# EAGLE schematic _ELRS_USB_TX.21faa46a-9219-4400-95b4-93692d36feac (EAGLE 9.7.0)

## Sheet 1 of 5: USB-C, protection and USB-UART
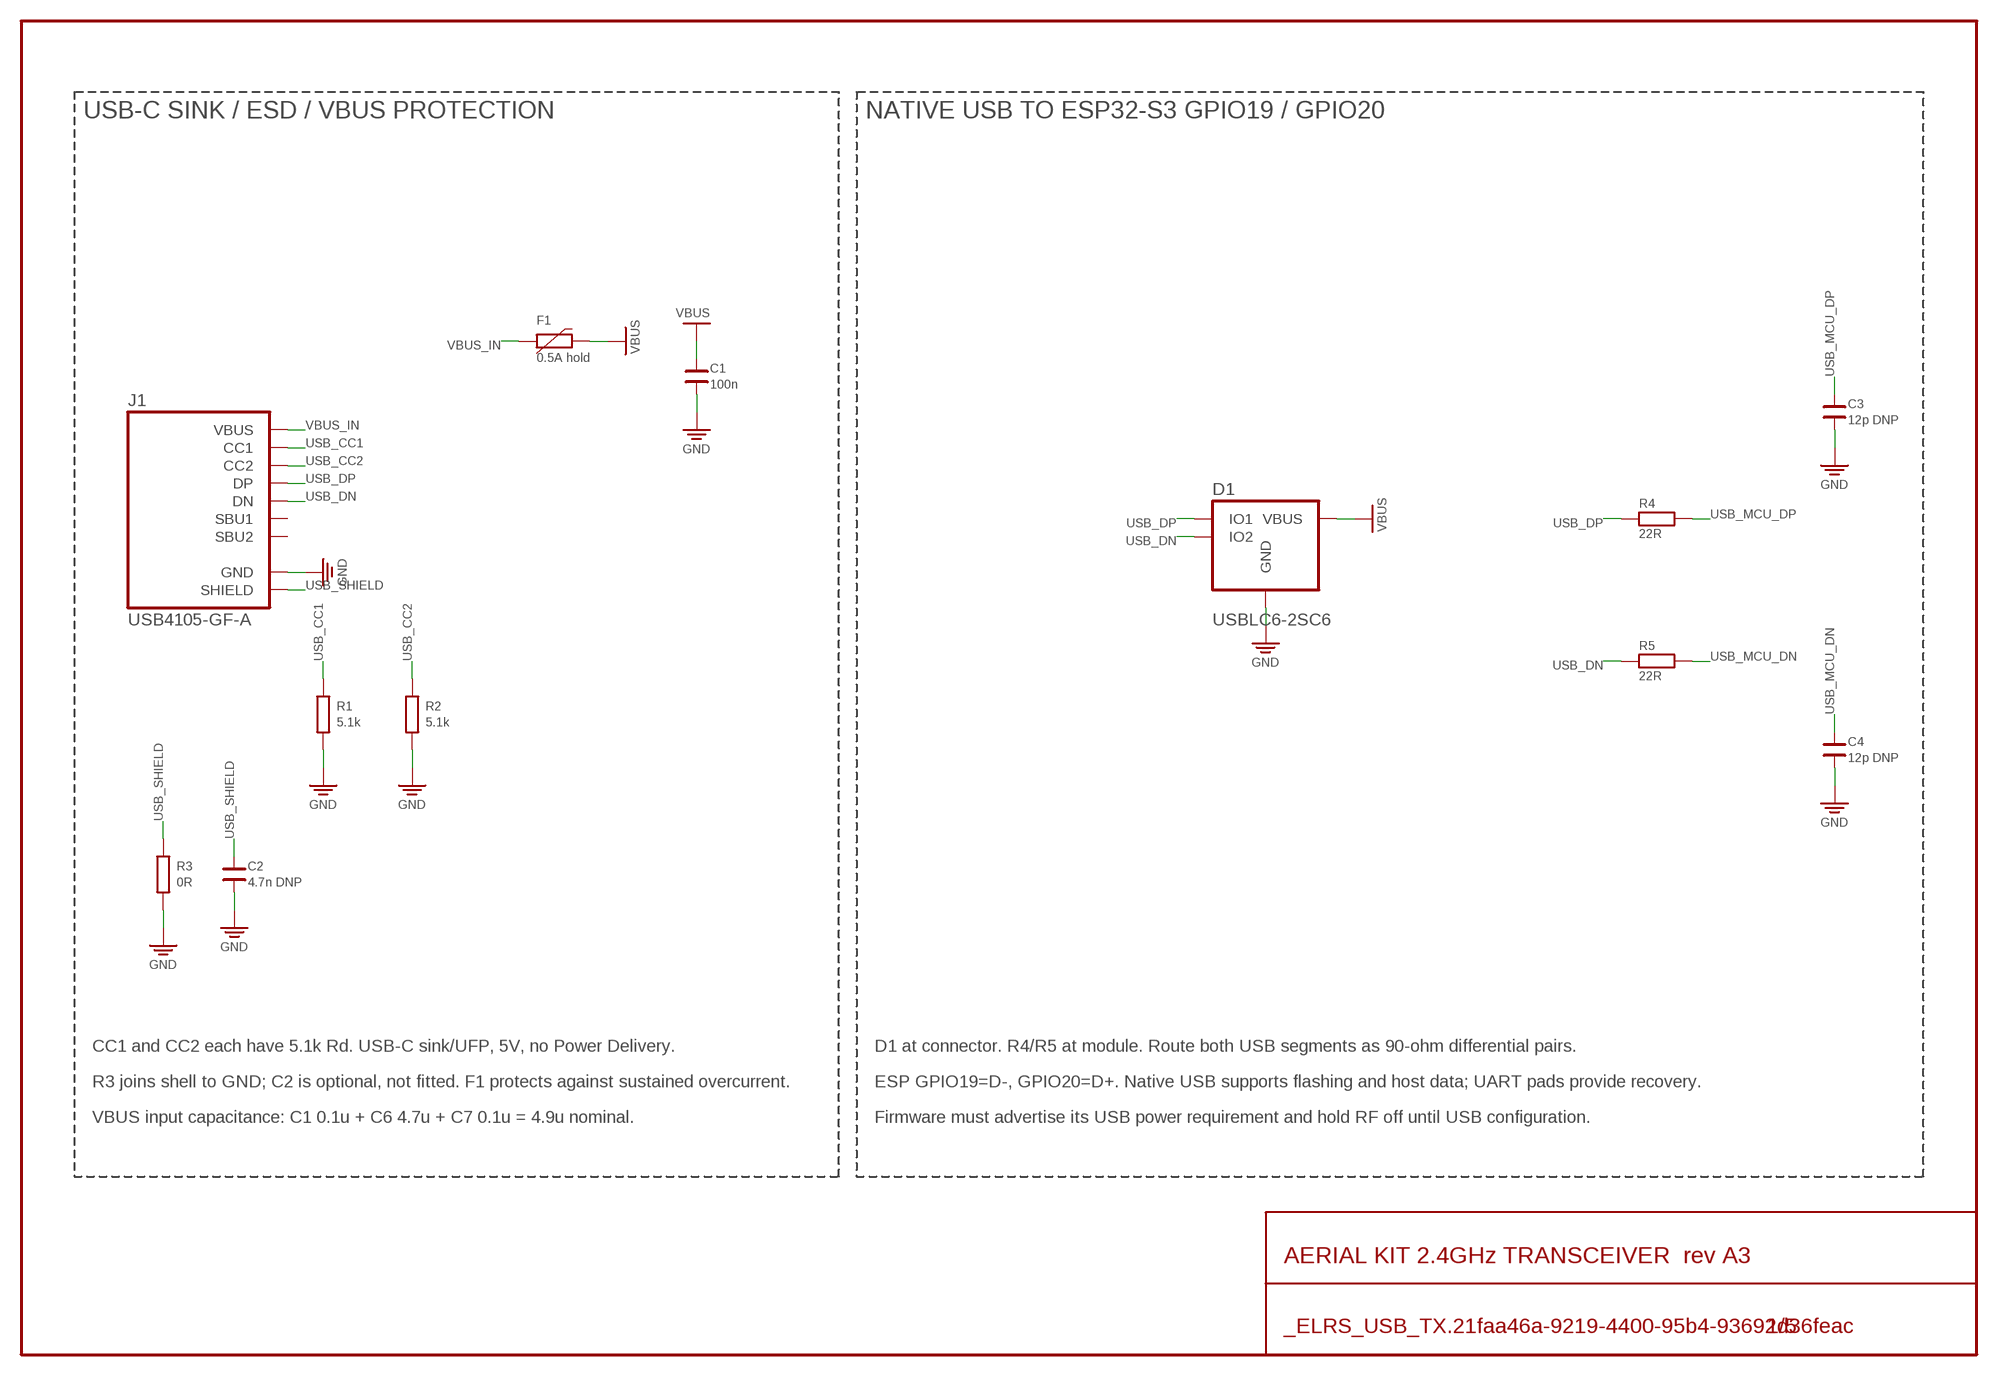
[diagram p0: schematic, sheet 1]

### Parts
C1  100n  C0402  [C0402]
C2  4.7n DNP  C0402  [C0402]
C3  12p DNP  C0402  [C0402]
C4  12p DNP  C0402  [C0402]
D1  USBLC6-2SC6  [SOT23-6]
F1  0.5A hold  PTC0805  [F0805]
J1  USB4105-GF-A  USB_CUSB4105  [USB4105_GF_A]
R1  5.1k  R0402  [R0402]
R2  5.1k  R0402  [R0402]
R3  0R  R0402  [R0402]
R4  22R  R0402  [R0402]
R5  22R  R0402  [R0402]

### Nets
GND [power]: C1.1 C2.1 C3.1 C4.1 D1.2(GND) J1.A1B12(GND) J1.B12A1(GND) R1.1 R2.1 R3.1 ; supply symbol labelled SUP_GND ; also sheet 2,3,4,5
USB_CC1: J1.A5(CC1) R1.2
USB_CC2: J1.B5(CC2) R2.2
USB_DN [usb90]: D1.3(IO2) D1.4(IO2) J1.A7(DN) J1.B7(DN) R5.1
USB_DP [usb90]: D1.1(IO1) D1.6(IO1) J1.A6(DP) J1.B6(DP) R4.1
USB_MCU_DN [usb90]: C4.2 R5.2 ; also sheet 3
USB_MCU_DP [usb90]: C3.2 R4.2 ; also sheet 3
USB_SHIELD: C2.2 J1.S1(SHIELD) J1.S1B(SHIELD) J1.S1T(SHIELD) J1.S2(SHIELD) J1.S2B(SHIELD) J1.S2T(SHIELD) J1.S3(SHIELD) J1.S3B(SHIELD) J1.S3T(SHIELD) J1.S4(SHIELD) J1.S4B(SHIELD) J1.S4T(SHIELD) R3.2
VBUS [power]: C1.2 D1.5(VBUS) F1.2 ; supply symbol labelled SUP_VBUS ; also sheet 2,5
VBUS_IN [power]: F1.1 J1.A4B9(VBUS) J1.B9A4(VBUS)
Unconnected: J1.A8(SBU1) J1.B8(SBU2)

### Notes on the sheet
- USB-C SINK / ESD / VBUS PROTECTION | NATIVE USB TO ESP32-S3 GPIO19 / GPIO20
- CC1 and CC2 each have 5.1k Rd. USB-C sink/UFP, 5V, no Power Delivery. | D1 at connector. R4/R5 at module. Route both USB segments as 90-ohm differential pairs.
- R3 joins shell to GND; C2 is optional, not fitted. F1 protects against sustained overcurrent. | ESP GPIO19=D-, GPIO20=D+. Native USB supports flashing and host data; UART pads provide recovery.
- VBUS input capacitance: C1 0.1u + C6 4.7u + C7 0.1u = 4.9u nominal. | Firmware must advertise its USB power requirement and hold RF off until USB configuration.

## Sheet 2 of 5
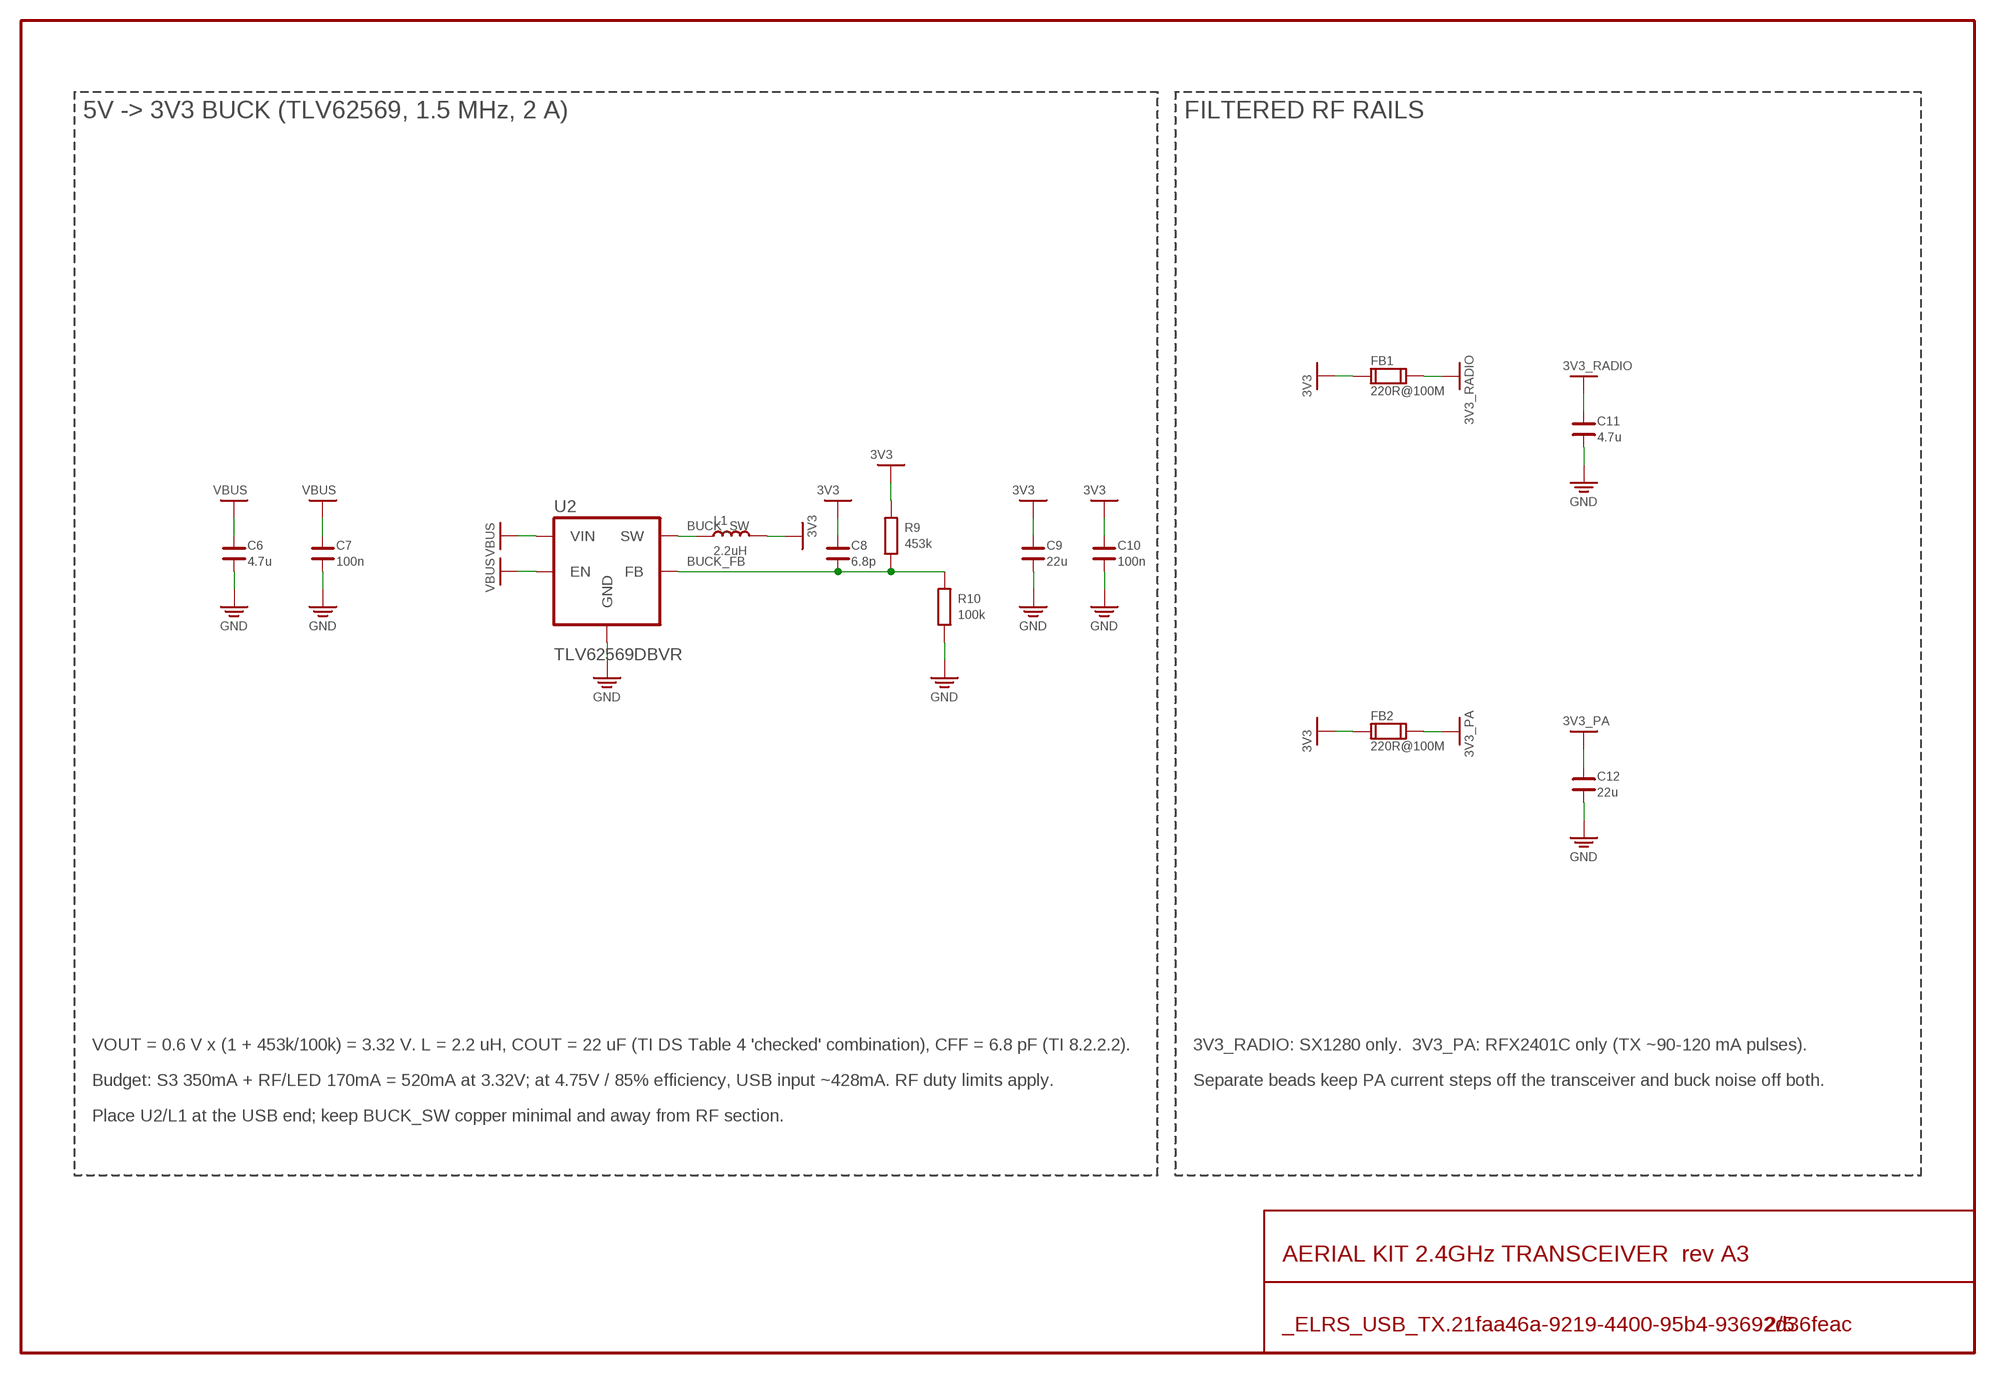
[diagram p1: schematic, sheet 2]

### Parts
C6  4.7u  C0603  [C0603]
C7  100n  C0402  [C0402]
C8  6.8p  C0402  [C0402]
C9  22u  C0805  [C0805]
C10  100n  C0402  [C0402]
C11  4.7u  C0603  [C0603]
C12  22u  C0805  [C0805]
FB1  220R@100M  FB0603  [FB0603]
FB2  220R@100M  FB0603  [FB0603]
L1  2.2uH  LDFE201610  [DFE201610]
R9  453k  R0402  [R0402]
R10  100k  R0402  [R0402]
U2  TLV62569DBVR  TLV62569DBV  [SOT23-5]

### Nets
3V3 [power]: C8.2 C9.2 C10.2 FB1.1 FB2.1 L1.2 R9.2 ; supply symbol labelled SUP_3V3 ; also sheet 3,5
3V3_PA [power]: C12.2 FB2.2 ; supply symbol labelled SUP_3V3_PA ; also sheet 4
3V3_RADIO [power]: C11.2 FB1.2 ; supply symbol labelled SUP_3V3_RADIO ; also sheet 4
BUCK_FB: C8.1 R9.1 R10.2 U2.5(FB)
BUCK_SW [power]: L1.1 U2.3(SW)
GND [power]: C6.1 C7.1 C9.1 C10.1 C11.1 C12.1 R10.1 U2.2(GND) ; supply symbol labelled SUP_GND ; also sheet 1,3,4,5
VBUS [power]: C6.2 C7.2 U2.1(EN) U2.4(VIN) ; supply symbol labelled SUP_VBUS ; also sheet 1,5

### Notes on the sheet
- 5V -> 3V3 BUCK (TLV62569, 1.5 MHz, 2 A) | FILTERED RF RAILS
- VOUT = 0.6 V x (1 + 453k/100k) = 3.32 V. L = 2.2 uH, COUT = 22 uF (TI DS Table 4 'checked' combination), CFF = 6.8 pF (TI 8.2.2.2). | 3V3_RADIO: SX1280 only.  3V3_PA: RFX2401C only (TX ~90-120 mA pulses).
- Budget: S3 350mA + RF/LED 170mA = 520mA at 3.32V; at 4.75V / 85% efficiency, USB input ~428mA. RF duty limits apply. | Separate beads keep PA current steps off the transceiver and buck noise off both.
- Place U2/L1 at the USB end; keep BUCK_SW copper minimal and away from RF section.

## Sheet 3 of 5
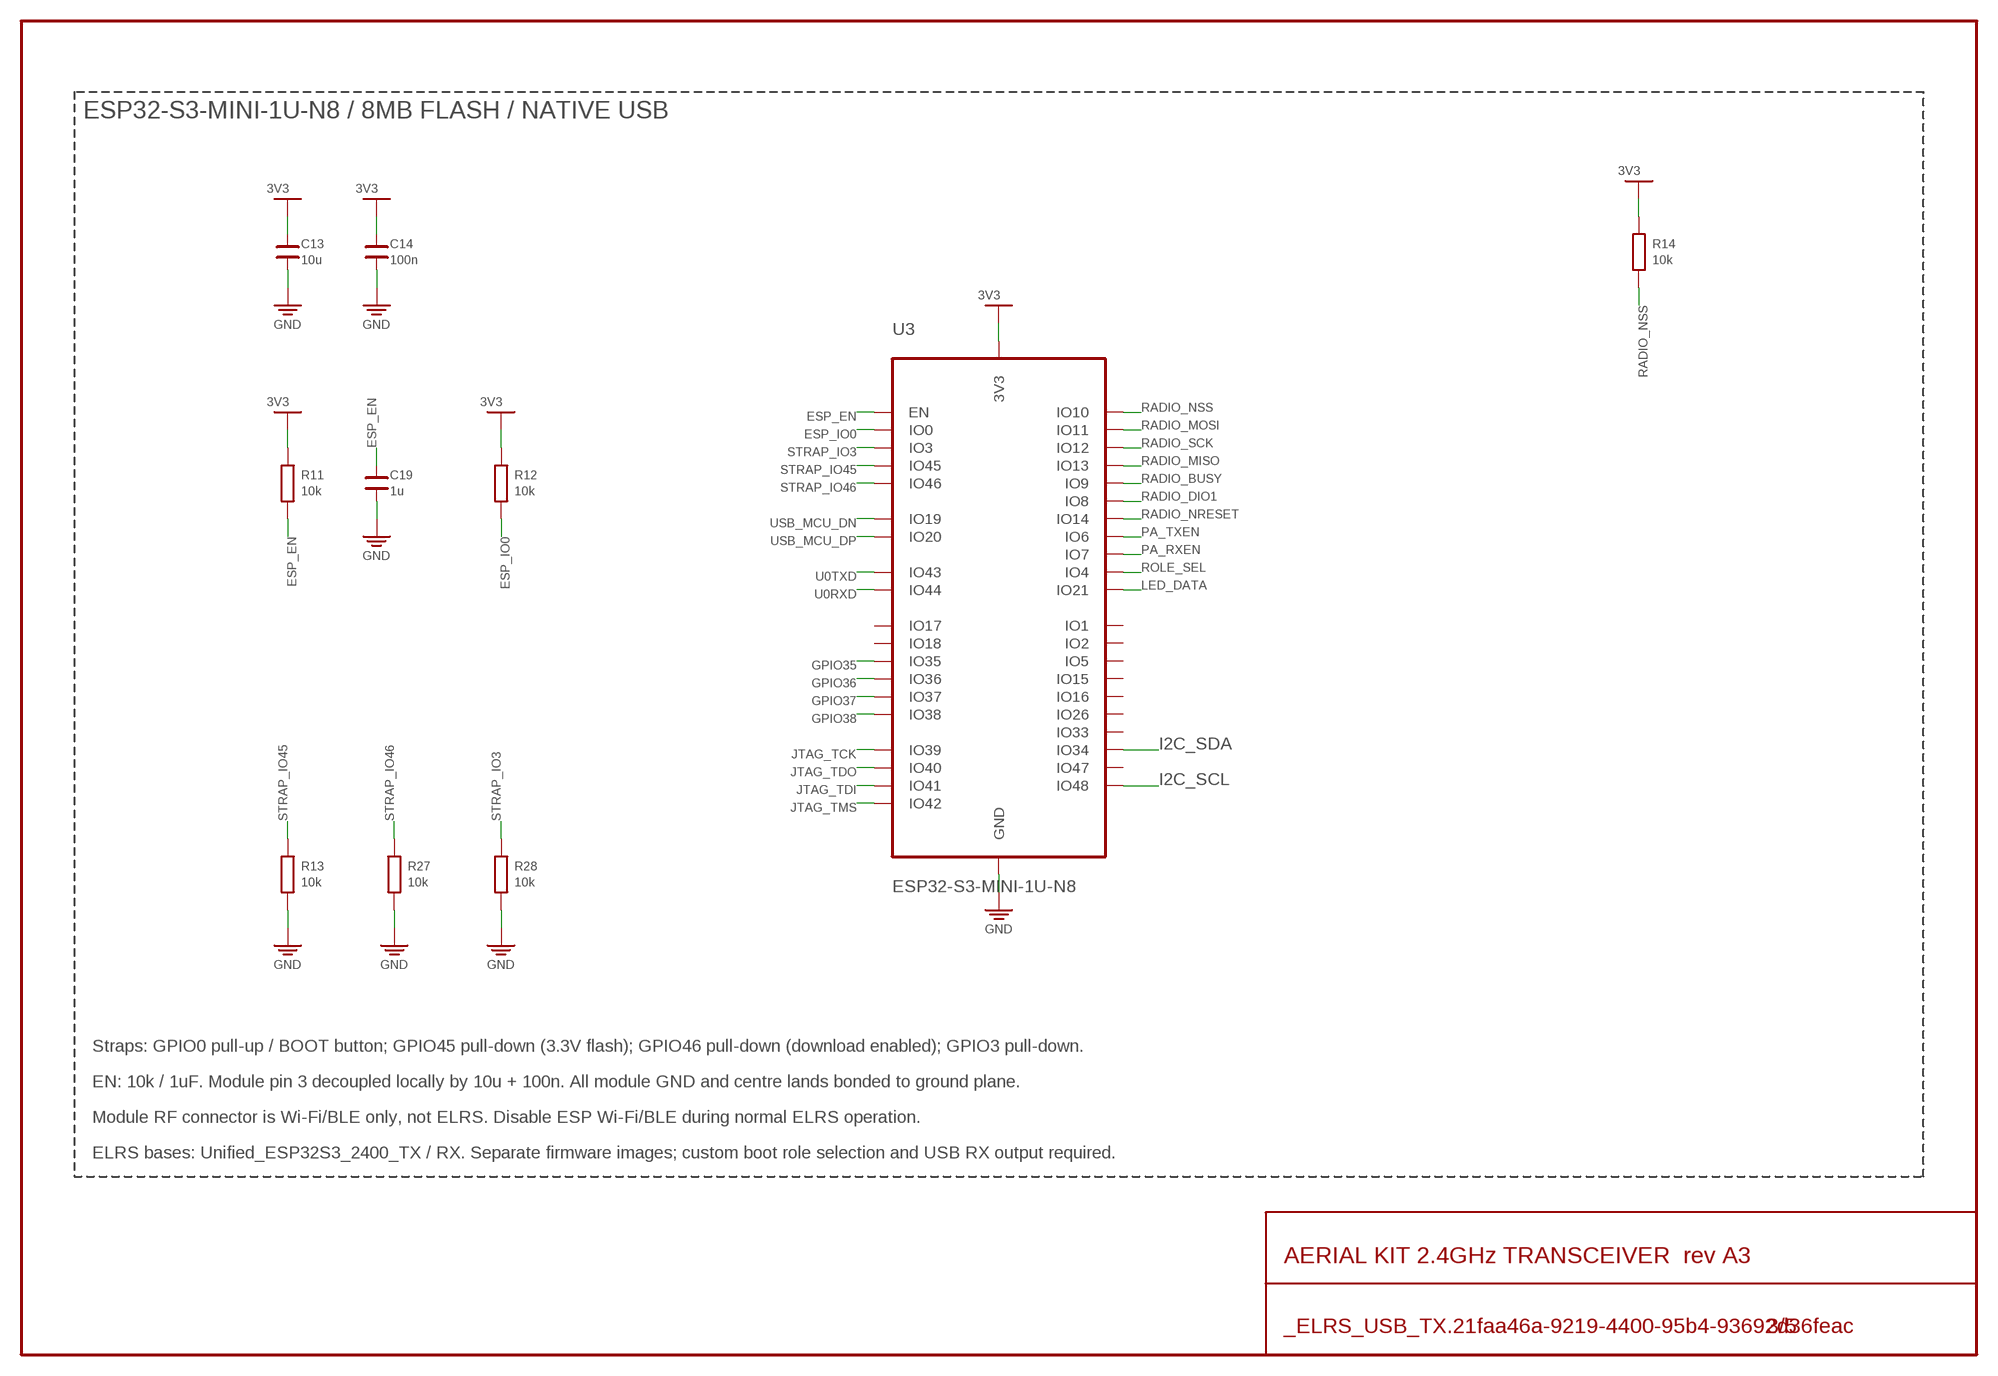
[diagram p2: schematic, sheet 3]

### Parts
C13  10u  C0603  [C0603]
C14  100n  C0402  [C0402]
C19  1u  C0402  [C0402]
R11  10k  R0402  [R0402]
R12  10k  R0402  [R0402]
R13  10k  R0402  [R0402]
R14  10k  R0402  [R0402]
R27  10k  R0402  [R0402]
R28  10k  R0402  [R0402]
U3  ESP32-S3-MINI-1U-N8  ESP32-S3-MINI-1UN8  [ESP32_S3_MINI_1U]

### Nets
3V3 [power]: C13.2 C14.2 R11.2 R12.2 R14.2 U3.3(3V3) ; supply symbol labelled SUP_3V3 ; also sheet 2,5
ESP_EN: C19.2 R11.1 U3.45(EN) ; also sheet 5
ESP_IO0: R12.1 U3.4(IO0) ; also sheet 5
GND [power]: C13.1 C14.1 C19.1 R13.1 R27.1 R28.1 U3.1(GND) U3.2(GND) U3.42(GND) U3.43(GND) U3.46(GND) U3.47(GND) U3.48(GND) U3.49(GND) U3.50(GND) U3.51(GND) U3.52(GND) U3.53(GND) U3.54(GND) U3.55(GND) U3.56(GND) U3.57(GND) U3.58(GND) U3.59(GND) U3.60(GND) U3.61_1(GND) U3.61_2(GND) U3.61_3(GND) U3.61_4(GND) U3.61_5(GND) U3.61_6(GND) U3.61_7(GND) U3.61_8(GND) U3.61_9(GND) U3.62(GND) U3.63(GND) U3.64(GND) U3.65(GND) ; supply symbol labelled SUP_GND ; also sheet 1,2,4,5
GPIO35: U3.31(IO35) ; also sheet 5
GPIO36: U3.32(IO36) ; also sheet 5
GPIO37: U3.33(IO37) ; also sheet 5
GPIO38: U3.34(IO38) ; also sheet 5
I2C_SCL: U3.30(IO48) ; also sheet 5
I2C_SDA: U3.29(IO34) ; also sheet 5
JTAG_TCK: U3.35(IO39) ; also sheet 5
JTAG_TDI: U3.37(IO41) ; also sheet 5
JTAG_TDO: U3.36(IO40) ; also sheet 5
JTAG_TMS: U3.38(IO42) ; also sheet 5
LED_DATA: U3.25(IO21) ; also sheet 5
PA_RXEN: U3.11(IO7) ; also sheet 4,5
PA_TXEN: U3.10(IO6) ; also sheet 4,5
RADIO_BUSY: U3.13(IO9) ; also sheet 4,5
RADIO_DIO1: U3.12(IO8) ; also sheet 4,5
RADIO_MISO: U3.17(IO13) ; also sheet 4
RADIO_MOSI: U3.15(IO11) ; also sheet 4
RADIO_NRESET: U3.18(IO14) ; also sheet 4
RADIO_NSS: R14.1 U3.14(IO10) ; also sheet 4
RADIO_SCK: U3.16(IO12) ; also sheet 4
ROLE_SEL: U3.8(IO4) ; also sheet 5
STRAP_IO3: R28.2 U3.7(IO3)
STRAP_IO45: R13.2 U3.41(IO45)
STRAP_IO46: R27.2 U3.44(IO46)
U0RXD: U3.40(IO44) ; also sheet 5
U0TXD: U3.39(IO43) ; also sheet 5
USB_MCU_DN [usb90]: U3.23(IO19) ; also sheet 1
USB_MCU_DP [usb90]: U3.24(IO20) ; also sheet 1
Unconnected: U3.5(IO1) U3.6(IO2) U3.9(IO5) U3.19(IO15) U3.20(IO16) U3.21(IO17) U3.22(IO18) U3.26(IO26) U3.27(IO47) U3.28(IO33)

### Notes on the sheet
- ESP32-S3-MINI-1U-N8 / 8MB FLASH / NATIVE USB
- Straps: GPIO0 pull-up / BOOT button; GPIO45 pull-down (3.3V flash); GPIO46 pull-down (download enabled); GPIO3 pull-down.
- EN: 10k / 1uF. Module pin 3 decoupled locally by 10u + 100n. All module GND and centre lands bonded to ground plane.
- Module RF connector is Wi-Fi/BLE only, not ELRS. Disable ESP Wi-Fi/BLE during normal ELRS operation.
- ELRS bases: Unified_ESP32S3_2400_TX / RX. Separate firmware images; custom boot role selection and USB RX output required.

## Sheet 4 of 5
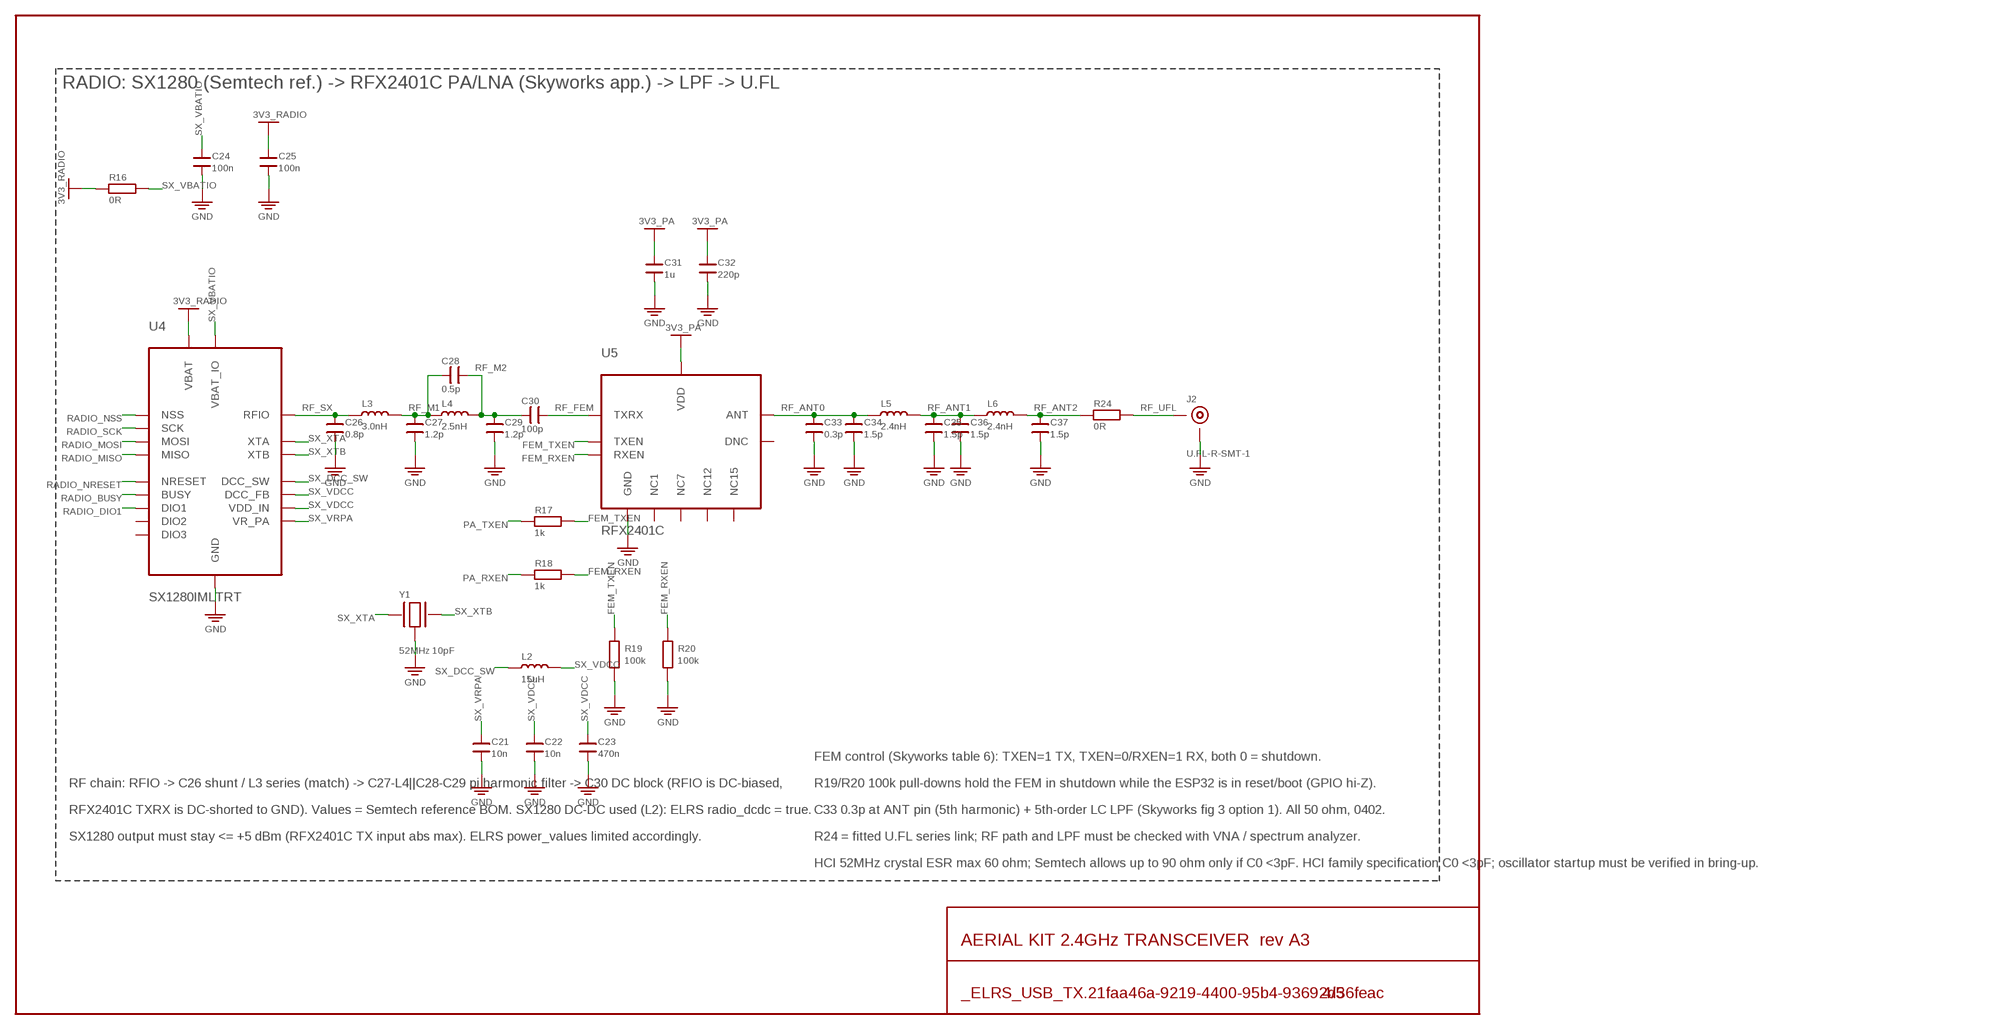
[diagram p3: schematic, sheet 4]

### Parts
C21  10n  C0402  [C0402]
C22  10n  C0402  [C0402]
C23  470n  C0402  [C0402]
C24  100n  C0402  [C0402]
C25  100n  C0402  [C0402]
C26  0.8p  C0402  [C0402]
C27  1.2p  C0402  [C0402]
C28  0.5p  C0402  [C0402]
C29  1.2p  C0402  [C0402]
C30  100p  C0402  [C0402]
C31  1u  C0402  [C0402]
C32  220p  C0402  [C0402]
C33  0.3p  C0402  [C0402]
C34  1.5p  C0402  [C0402]
C35  1.5p  C0402  [C0402]
C36  1.5p  C0402  [C0402]
C37  1.5p  C0402  [C0402]
J2  U.FL-R-SMT-1  UFL  [UFL_R_SMT]
L2  15uH  L0805  [L0805]
L3  3.0nH  L0402  [L0402]
L4  2.5nH  L0402  [L0402]
L5  2.4nH  L0402  [L0402]
L6  2.4nH  L0402  [L0402]
R16  0R  R0402  [R0402]
R17  1k  R0402  [R0402]
R18  1k  R0402  [R0402]
R19  100k  R0402  [R0402]
R20  100k  R0402  [R0402]
R24  0R  R0402  [R0402]
U4  SX1280IMLTRT  SX1280  [QFN24_4X4_SX1280]
U5  RFX2401C  [QFN16_3X3_RFX2401C]
Y1  52MHz 10pF  XTAL2016  [XTAL2016_4P]

### Nets
3V3_PA [power]: C31.2 C32.2 U5.14(VDD) U5.16(VDD) ; supply symbol labelled SUP_3V3_PA ; also sheet 2
3V3_RADIO [power]: C25.2 R16.1 U4.15(VBAT) ; supply symbol labelled SUP_3V3_RADIO ; also sheet 2
FEM_RXEN: R18.2 R20.2 U5.6(RXEN)
FEM_TXEN: R17.2 R19.2 U5.5(TXEN)
GND [power]: C21.1 C22.1 C23.1 C24.1 C25.1 C26.1 C27.1 C29.1 C31.1 C32.1 C33.1 C34.1 C35.1 C36.1 C37.1 J2.GND1(GND) J2.GND2(GND) R19.1 R20.1 U4.5(GND) U4.13(GND) U4.20(GND) U4.21(GND) U4.23(GND) U4.24(GND) U4.25(GND) U5.2(GND) U5.3(GND) U5.8(GND) U5.9(GND) U5.11(GND) U5.17(GND) Y1.2(GND) Y1.4(GND) ; supply symbol labelled SUP_GND ; also sheet 1,2,3,5
PA_RXEN: R18.1 ; also sheet 3,5
PA_TXEN: R17.1 ; also sheet 3,5
RADIO_BUSY: U4.7(BUSY) ; also sheet 3,5
RADIO_DIO1: U4.8(DIO1) ; also sheet 3,5
RADIO_MISO: U4.16(MISO) ; also sheet 3
RADIO_MOSI: U4.17(MOSI) ; also sheet 3
RADIO_NRESET: U4.3(NRESET) ; also sheet 3
RADIO_NSS: U4.19(NSS) ; also sheet 3
RADIO_SCK: U4.18(SCK) ; also sheet 3
RF_ANT0 [rf50]: C33.2 C34.2 L5.1 U5.10(ANT)
RF_ANT1 [rf50]: C35.2 C36.2 L5.2 L6.1
RF_ANT2 [rf50]: C37.2 L6.2 R24.1
RF_FEM [rf50]: C30.2 U5.4(TXRX)
RF_M1 [rf50]: C27.2 C28.1 L3.2 L4.1
RF_M2 [rf50]: C28.2 C29.2 C30.1 L4.2
RF_SX [rf50]: C26.2 L3.1 U4.22(RFIO)
RF_UFL [rf50]: J2.SIG R24.2
SX_DCC_SW: L2.1 U4.14(DCC_SW)
SX_VBATIO: C24.2 R16.2 U4.11(VBAT_IO)
SX_VDCC: C22.2 C23.2 L2.2 U4.2(VDD_IN) U4.12(DCC_FB)
SX_VRPA: C21.2 U4.1(VR_PA)
SX_XTA: U4.4(XTA) Y1.1(X1)
SX_XTB: U4.6(XTB) Y1.3(X2)
Unconnected: U4.9(DIO2) U4.10(DIO3) U5.1(NC1) U5.7(NC7) U5.12(NC12) U5.13(DNC) U5.15(NC15)

### Notes on the sheet
- RADIO: SX1280 (Semtech ref.) -> RFX2401C PA/LNA (Skyworks app.) -> LPF -> U.FL
- FEM control (Skyworks table 6): TXEN=1 TX, TXEN=0/RXEN=1 RX, both 0 = shutdown.
- RF chain: RFIO -> C26 shunt / L3 series (match) -> C27-L4||C28-C29 pi harmonic filter -> C30 DC block (RFIO is DC-biased, | R19/R20 100k pull-downs hold the FEM in shutdown while the ESP32 is in reset/boot (GPIO hi-Z).
- RFX2401C TXRX is DC-shorted to GND). Values = Semtech reference BOM. SX1280 DC-DC used (L2): ELRS radio_dcdc = true. | C33 0.3p at ANT pin (5th harmonic) + 5th-order LC LPF (Skyworks fig 3 option 1). All 50 ohm, 0402.
- SX1280 output must stay <= +5 dBm (RFX2401C TX input abs max). ELRS power_values limited accordingly. | R24 = fitted U.FL series link; RF path and LPF must be checked with VNA / spectrum analyzer.
- HCI 52MHz crystal ESR max 60 ohm; Semtech allows up to 90 ohm only if C0 <3pF. HCI family specification C0 <3pF; oscillator startup must be verified in bring-up.

## Sheet 5 of 5
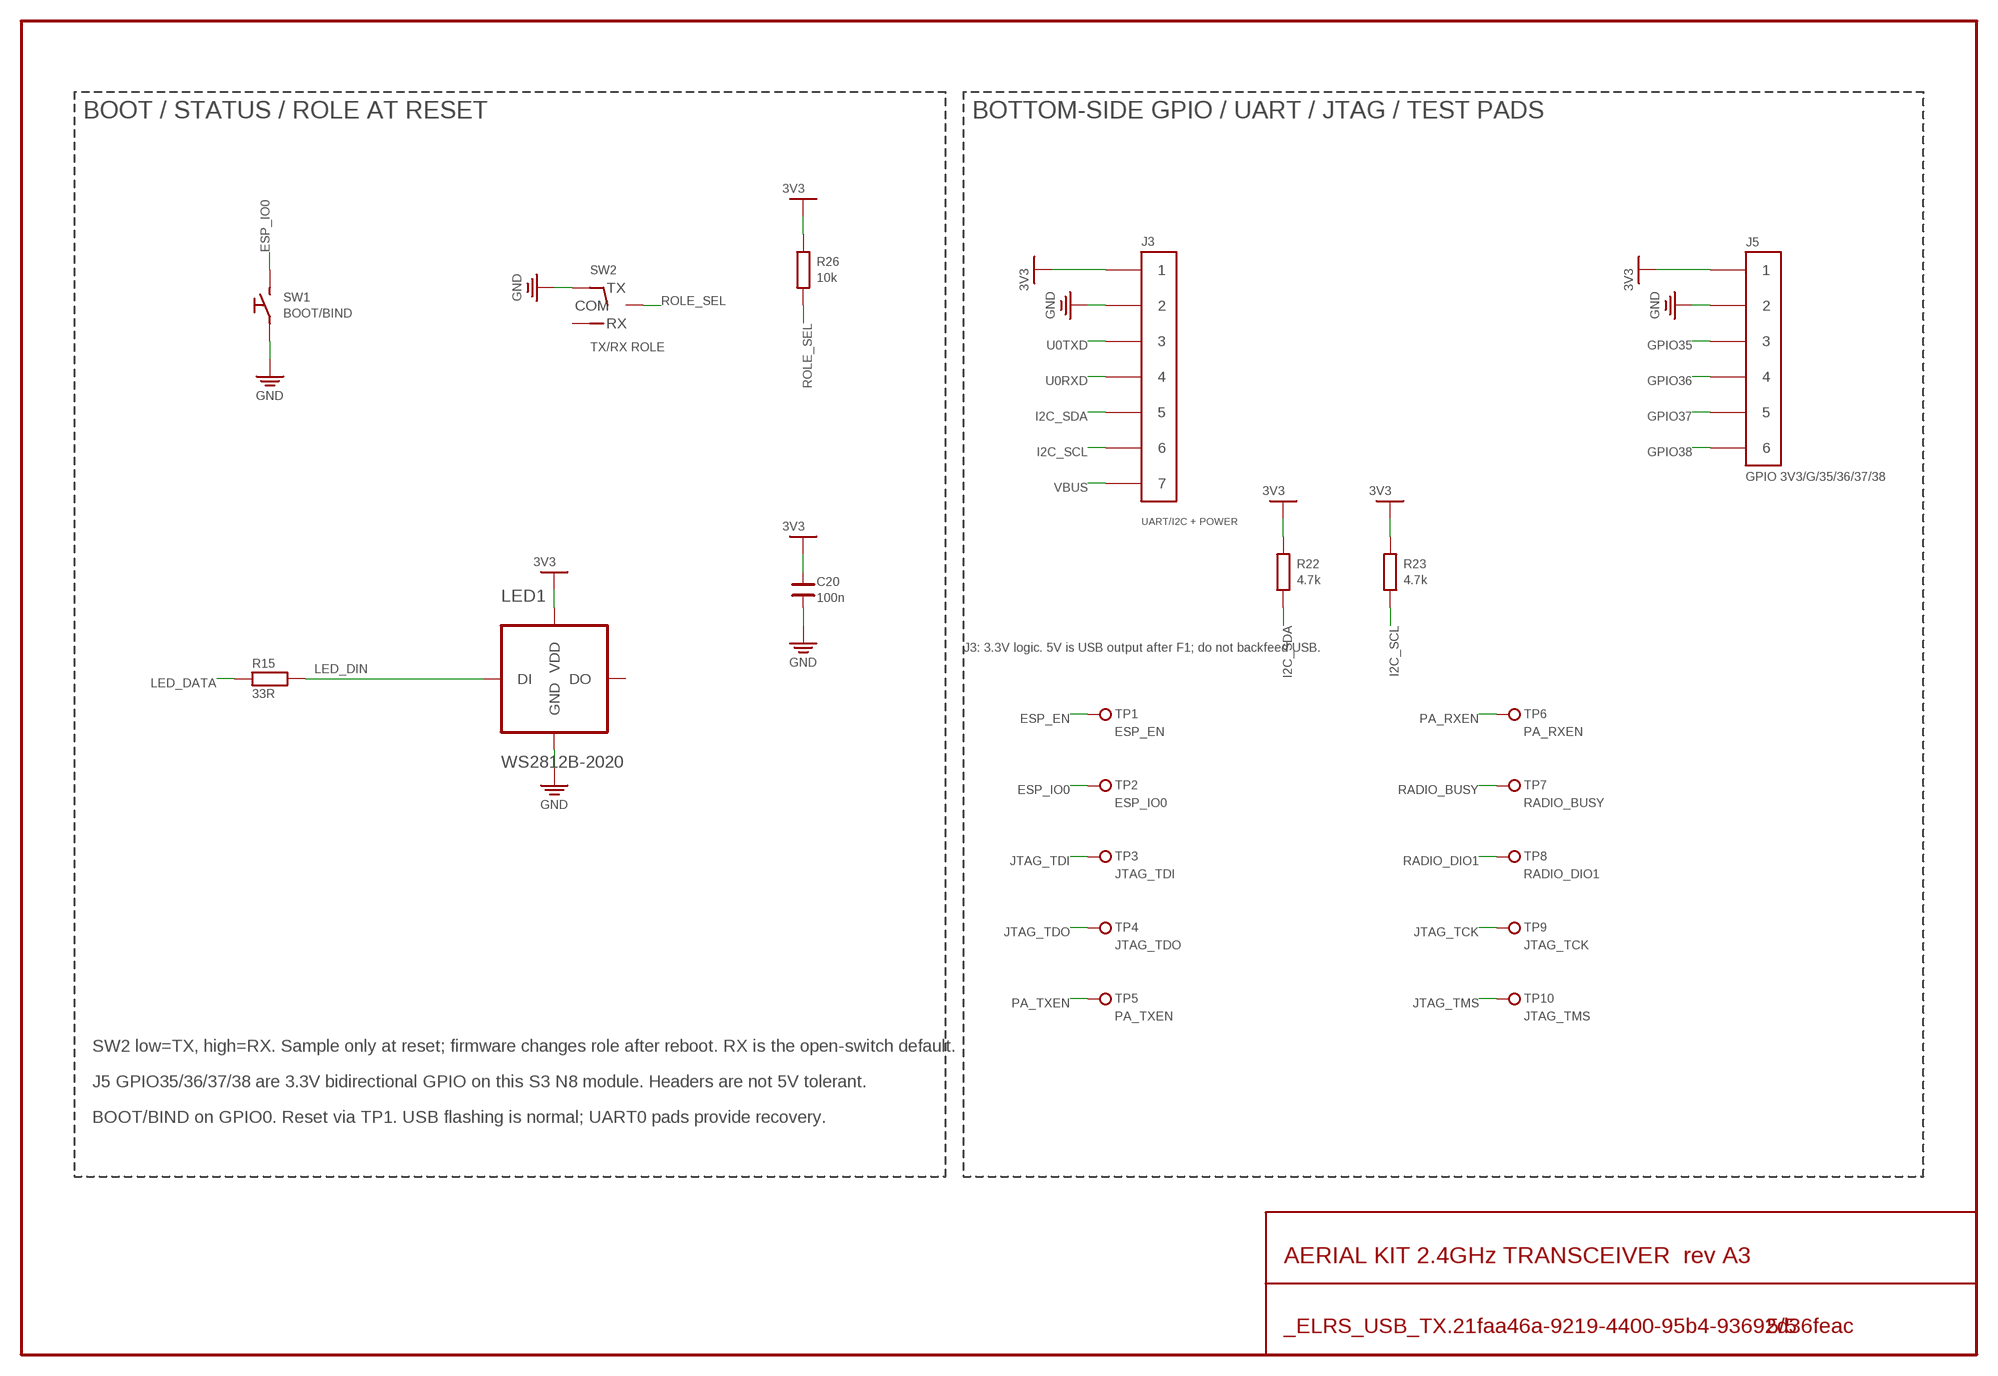
[diagram p4: schematic, sheet 5]

### Parts
C20  100n  C0402  [C0402]
J3  UART/I2C + POWER  HDR7  [PADS7_1P5]
J5  GPIO 3V3/G/35/36/37/38  HDR6  [PADS6_1P5]
LED1  WS2812B-2020  WS2812B2020  [LED2020_WS2812B]
R15  33R  R0402  [R0402]
R22  4.7k  R0402  [R0402]
R23  4.7k  R0402  [R0402]
R26  10k  R0402  [R0402]
SW1  BOOT/BIND  SWTS1088  [SW_TS1088]
SW2  TX/RX ROLE  SW_SPDTSSSS810701  [SW_SSSS810701]
TP1  ESP_EN  TP  [TP_1MM]
TP2  ESP_IO0  TP  [TP_1MM]
TP3  JTAG_TDI  TP  [TP_1MM]
TP4  JTAG_TDO  TP  [TP_1MM]
TP5  PA_TXEN  TP  [TP_1MM]
TP6  PA_RXEN  TP  [TP_1MM]
TP7  RADIO_BUSY  TP  [TP_1MM]
TP8  RADIO_DIO1  TP  [TP_1MM]
TP9  JTAG_TCK  TP  [TP_1MM]
TP10  JTAG_TMS  TP  [TP_1MM]

### Nets
3V3 [power]: C20.2 J3.1 J5.1 LED1.4(VDD) R22.2 R23.2 R26.2 ; supply symbol labelled SUP_3V3 ; also sheet 2,3
ESP_EN: TP1.1(TP) ; also sheet 3
ESP_IO0: SW1.2 TP2.1(TP) ; also sheet 3
GND [power]: C20.1 J3.2 J5.2 LED1.2(GND) SW1.1 SW2.1(TX) ; supply symbol labelled SUP_GND ; also sheet 1,2,3,4
GPIO35: J5.3 ; also sheet 3
GPIO36: J5.4 ; also sheet 3
GPIO37: J5.5 ; also sheet 3
GPIO38: J5.6 ; also sheet 3
I2C_SCL: J3.6 R23.1 ; also sheet 3
I2C_SDA: J3.5 R22.1 ; also sheet 3
JTAG_TCK: TP9.1(TP) ; also sheet 3
JTAG_TDI: TP3.1(TP) ; also sheet 3
JTAG_TDO: TP4.1(TP) ; also sheet 3
JTAG_TMS: TP10.1(TP) ; also sheet 3
LED_DATA: R15.1 ; also sheet 3
LED_DIN: LED1.3(DI) R15.2
PA_RXEN: TP6.1(TP) ; also sheet 3,4
PA_TXEN: TP5.1(TP) ; also sheet 3,4
RADIO_BUSY: TP7.1(TP) ; also sheet 3,4
RADIO_DIO1: TP8.1(TP) ; also sheet 3,4
ROLE_SEL: R26.1 SW2.2(COM) ; also sheet 3
U0RXD: J3.4 ; also sheet 3
U0TXD: J3.3 ; also sheet 3
VBUS [power]: J3.7 ; also sheet 1,2
Unconnected: LED1.1(DO) SW2.3(RX)

### Notes on the sheet
- BOOT / STATUS / ROLE AT RESET | BOTTOM-SIDE GPIO / UART / JTAG / TEST PADS
- J3: 3.3V logic. 5V is USB output after F1; do not backfeed USB.
- SW2 low=TX, high=RX. Sample only at reset; firmware changes role after reboot. RX is the open-switch default.
- J5 GPIO35/36/37/38 are 3.3V bidirectional GPIO on this S3 N8 module. Headers are not 5V tolerant.
- BOOT/BIND on GPIO0. Reset via TP1. USB flashing is normal; UART0 pads provide recovery.

## Library data of the parts
C1 C7 C10 C14 C20 C24 C25 = elrs_usb_tx:C: Ceramic capacitor; LCSC: C1525; MFR: Samsung; MPN: CL05B104KO5NNNC
C2 = elrs_usb_tx:C: Ceramic capacitor; DNP: yes; LCSC: C84705; MFR: Samsung; MPN: CL05B472KB5NNNC
C3 C4 = elrs_usb_tx:C: Ceramic capacitor; DNP: yes; LCSC: C76948; MFR: Murata; MPN: GRM1555C1H120JA01D
C6 C11 = elrs_usb_tx:C: Ceramic capacitor; LCSC: C19666; MFR: Samsung; MPN: CL10A475KO8NNNC
C8 = elrs_usb_tx:C: Ceramic capacitor; LCSC: C237286; MFR: Murata; MPN: GRM1555C1H6R8DA01D
C9 C12 = elrs_usb_tx:C: Ceramic capacitor; LCSC: C45783; MFR: Samsung; MPN: CL21A226MAQNNNE
C13 = elrs_usb_tx:C: Ceramic capacitor; LCSC: C19702; MFR: Samsung; MPN: CL10A106KP8NNNC
C19 C31 = elrs_usb_tx:C: Ceramic capacitor; LCSC: C52923; MFR: Samsung; MPN: CL05A105KA5NQNC
C21 C22 = elrs_usb_tx:C: Ceramic capacitor; LCSC: C15195; MFR: Samsung; MPN: CL05B103KB5NNNC
C23 = elrs_usb_tx:C: Ceramic capacitor; LCSC: C77003; MFR: Murata; MPN: GRM155R61A474KE15D
C26 = elrs_usb_tx:C: Ceramic capacitor; LCSC: C76988; MFR: Murata; MPN: GRM1555C1HR80BA01D; NOTE: C0G RF, place per layout
C27 C29 = elrs_usb_tx:C: Ceramic capacitor; LCSC: C76955; MFR: Murata; MPN: GRM1555C1H1R2CA01D; NOTE: C0G RF, place per layout
C28 = elrs_usb_tx:C: Ceramic capacitor; LCSC: C77179; MFR: Murata; MPN: GRM1555C1HR50BA01D; NOTE: C0G RF, place per layout
C30 = elrs_usb_tx:C: Ceramic capacitor; LCSC: C77177; MFR: Murata; MPN: GRM1555C1H101JA01D; NOTE: C0G RF, place per layout
C32 = elrs_usb_tx:C: Ceramic capacitor; LCSC: C307445; MFR: Samsung; MPN: CL05C221JB5NNNC
C33 = elrs_usb_tx:C: Ceramic capacitor; LCSC: C92338; MFR: Murata; MPN: GRM1555C1HR30WA01D; NOTE: C0G RF, place per layout
C34-C37 = elrs_usb_tx:C: Ceramic capacitor; LCSC: C76957; MFR: Murata; MPN: GRM1555C1H1R5BA01D; NOTE: C0G RF, place per layout
D1 = elrs_usb_tx:USBLC6-2: ST USBLC6-2SC6 USB ESD protection. Pins 1&6 = I/O1, 3&4 = I/O2 (flow-through), 2 GND, 5 VBUS; LCSC: C7519; MFR: ST; MPN: USBLC6-2SC6
F1 = elrs_usb_tx:PTC: PTC resettable fuse; LCSC: C207022; MFR: Littelfuse; MPN: 0805L050WR
FB1 FB2 = elrs_usb_tx:FB: Ferrite bead; LCSC: C80165; MFR: Murata; MPN: BLM18PG221SN1D
J1 = elrs_usb_tx:USB_C: USB 2.0 Type-C receptacle (UFP). A6/B6 = D+, A7/B7 = D-; LCSC: C3020560; MFR: GCT; MPN: USB4105-GF-A
J2 = elrs_usb_tx:UFL: Hirose U.FL receptacle; LCSC: C88374; MFR: Hirose; MPN: U.FL-R-SMT-1(80)
J3 = elrs_usb_tx:HDR7: Combined UART/I2C dual-supply solder pads; LCSC: -; MFR: -; MPN: bare pads
J5 = elrs_usb_tx:HDR6: 6-way GPIO solder pad header; LCSC: -; MFR: -; MPN: bare pads
L1 = elrs_usb_tx:L: Inductor; LCSC: C337891; MFR: Murata; MPN: DFE201610E-2R2M=P2
L2 = elrs_usb_tx:L: Inductor; LCSC: C383402; MFR: TDK; MPN: MLZ2012M150WT000
L3 = elrs_usb_tx:L: Inductor; LCSC: C2041661; MFR: Murata; MPN: LQW15AN3N0B80D
L4 = elrs_usb_tx:L: Inductor; LCSC: C703121; MFR: Murata; MPN: LQW15AN2N5C00D
L5 L6 = elrs_usb_tx:L: Inductor; LCSC: C3911311; MFR: Murata; MPN: LQG15HN2N4B02D
LED1 = elrs_usb_tx:WS2812B: Addressable RGB LED, 3.3-5.3 V (V6); LCSC: C52917434; MFR: Worldsemi; MPN: WS2812B-2020-V6
R1 R2 = elrs_usb_tx:R: Chip resistor; LCSC: C25905; MFR: UNI-ROYAL; MPN: 0402WGF5101TCE
R3 R16 = elrs_usb_tx:R: Chip resistor; LCSC: C17168; MFR: UNI-ROYAL; MPN: 0402WGF0000TCE
R4 R5 = elrs_usb_tx:R: Chip resistor; LCSC: C25092; MFR: UNI-ROYAL; MPN: 0402WGF220JTCE
R9 = elrs_usb_tx:R: Chip resistor; LCSC: C27009; MFR: UNI-ROYAL; MPN: 0402WGF4533TCE
R10 R19 R20 = elrs_usb_tx:R: Chip resistor; LCSC: C25741; MFR: UNI-ROYAL; MPN: 0402WGF1003TCE
R11-R14 R26-R28 = elrs_usb_tx:R: Chip resistor; LCSC: C25744; MFR: UNI-ROYAL; MPN: 0402WGF1002TCE
R15 = elrs_usb_tx:R: Chip resistor; LCSC: C25105; MFR: UNI-ROYAL; MPN: 0402WGF330JTCE
R17 R18 = elrs_usb_tx:R: Chip resistor; LCSC: C11702; MFR: UNI-ROYAL; MPN: 0402WGF1001TCE
R22 R23 = elrs_usb_tx:R: Chip resistor; LCSC: C25900; MFR: UNI-ROYAL; MPN: 0402WGF4701TCE
R24 = elrs_usb_tx:R: Chip resistor; LCSC: C17168; MFR: UNI-ROYAL; MPN: 0402WGF0000TCE; NOTE: U.FL series link / measurement isolation
SW1 = elrs_usb_tx:SW: SPST tact switch; LCSC: C455280; MFR: XUNPU; MPN: TS-1088R-02026
SW2 = elrs_usb_tx:SW_SPDT: Two-position boot role select; LCSC: C97433; MFR: Alps Alpine; MPN: SSSS810701
TP1-TP10 = elrs_usb_tx:TP: Test pad; LCSC: -; MFR: -; MPN: bare pad
U2 = elrs_usb_tx:TLV62569: TI TLV62569 2 A 1.5 MHz sync buck, SOT-23-5: 1 EN, 2 GND, 3 SW, 4 VIN, 5 FB; LCSC: C141836; MFR: TI; MPN: TLV62569DBVR
U3 = elrs_usb_tx:ESP32-S3-MINI-1U: Espressif ESP32-S3-MINI-1U-N8: 8 MB flash, no PSRAM, native USB. Module antenna connector is ESP Wi-Fi/BLE only.; LCSC: C2980299; MFR: Espressif; MPN: ESP32-S3-MINI-1U-N8
U4 = elrs_usb_tx:SX1280: Semtech SX1280 2.4 GHz LoRa/FLRC transceiver; LCSC: C125969; MFR: Semtech; MPN: SX1280IMLTRT
U5 = elrs_usb_tx:RFX2401C: Skyworks RFX2401C 2.4 GHz PA/LNA/TR-switch FEM; LCSC: C19213; MFR: Skyworks; MPN: RFX2401C
Y1 = elrs_usb_tx:XTAL: 4-pad SMD crystal, pads 2/4 to lid; LCSC: C3034316; MFR: HCI; MPN: XC21M4-52.000-F10NNHPL; NOTE: 52 MHz, CL 10 pF, +-10 ppm tol/stab, ESR<=60R, 2016 4-pad (#1/#3 xtal). Alt: NDK NX2016SA-52M-EXS00A-CS07103 (C6249276)

## Net classes
0 default: width 0.15 mm, drill 0.2 mm
1 power: width 0.25 mm, drill 0.2 mm
2 rf50: width 0.2 mm, drill 0.3 mm
3 usb90: width 0.2 mm, drill 0.2 mm